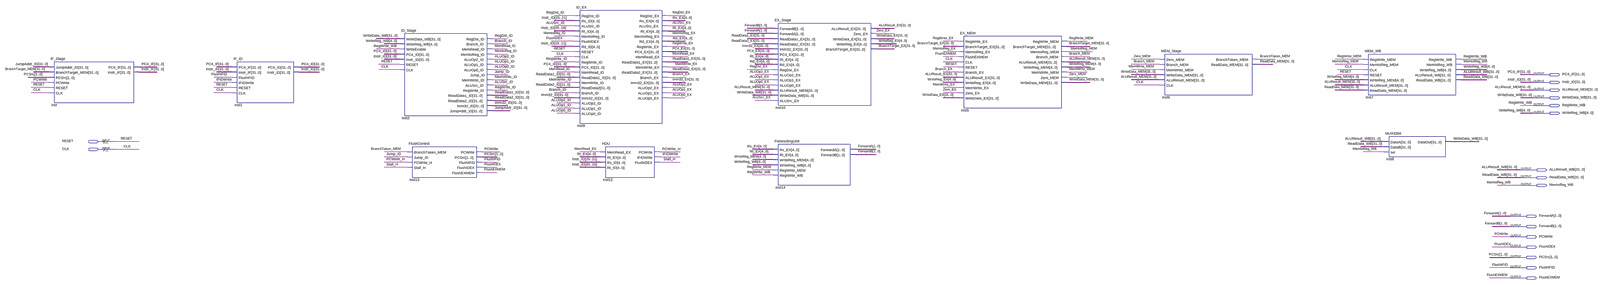
[diagram p0: schematic sheet, whole]
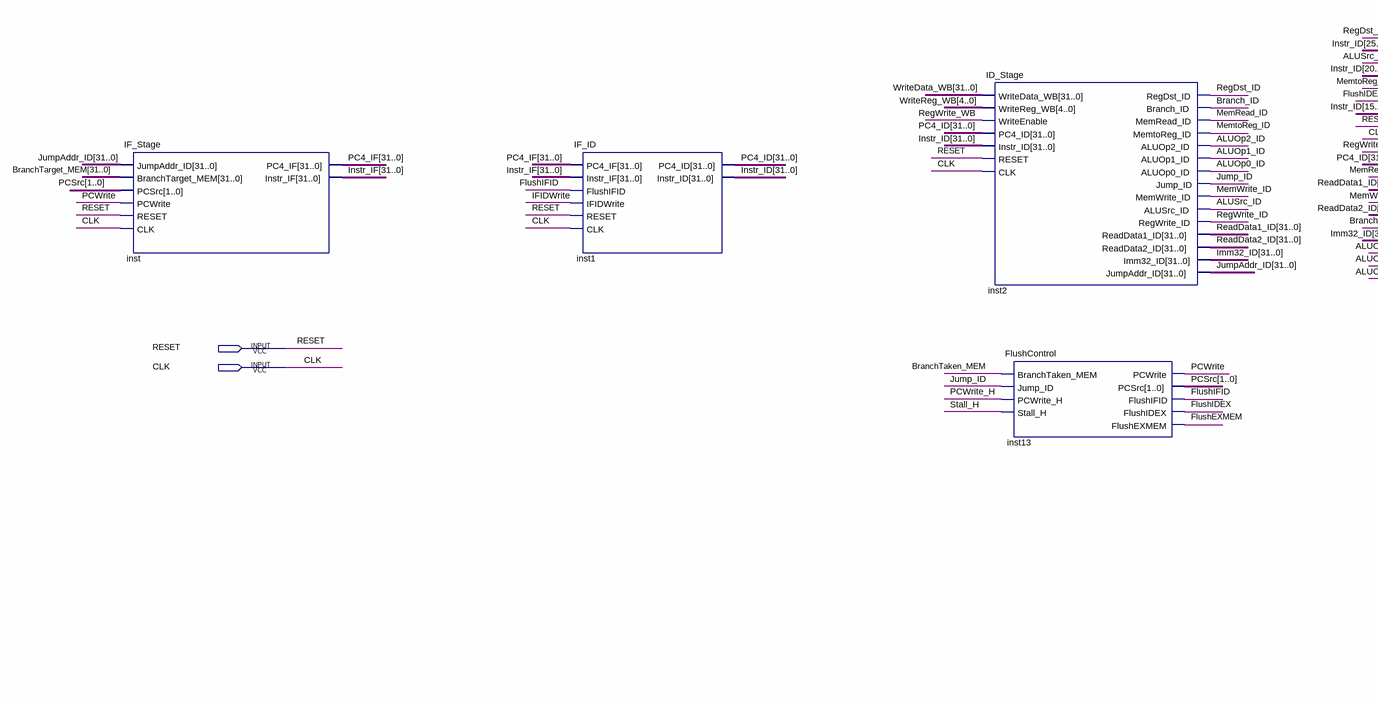
[diagram p1: schematic sheet, left part]
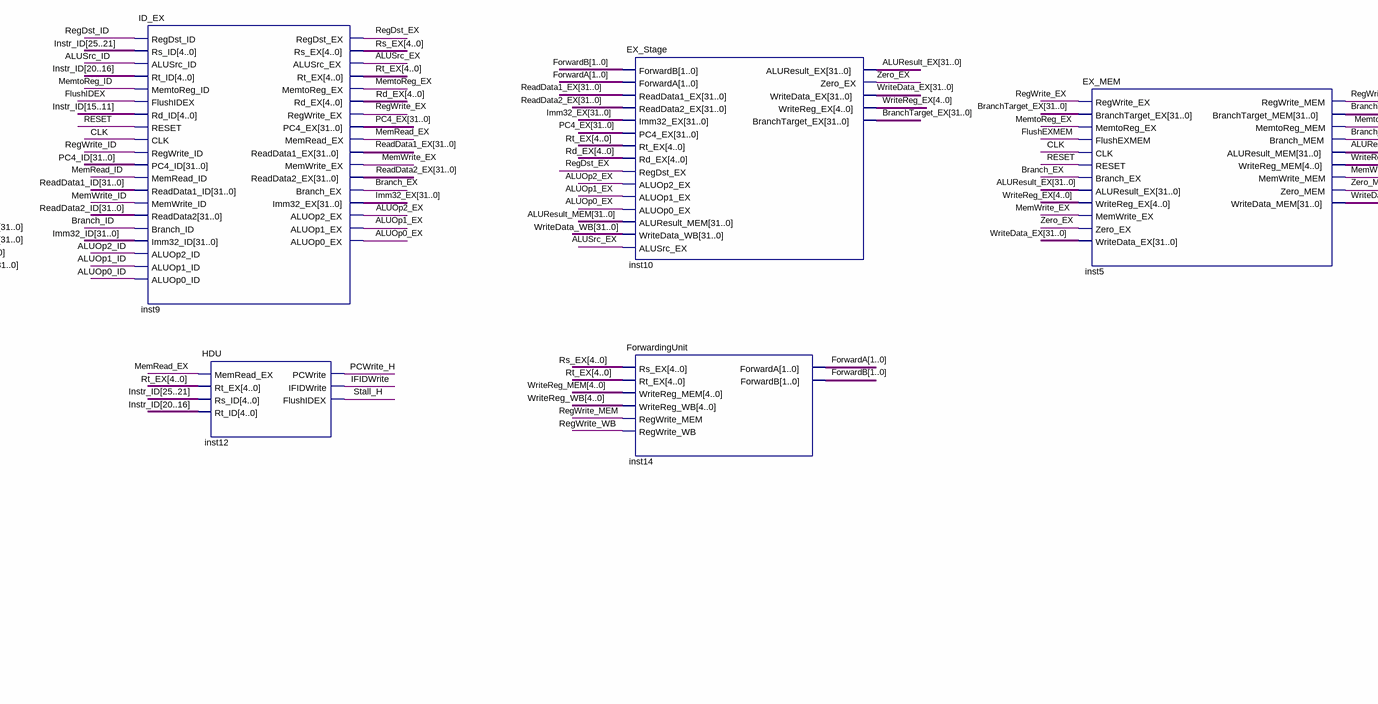
[diagram p2: schematic sheet, centre part]
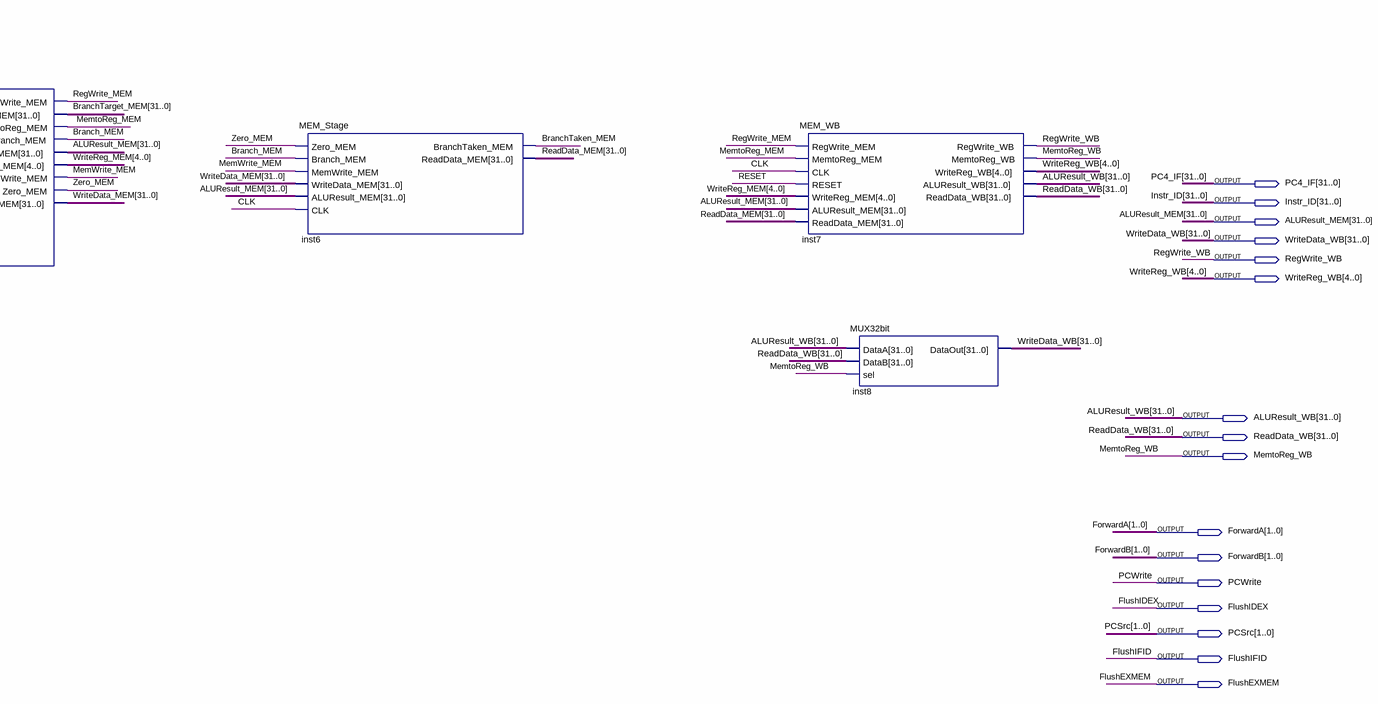
[diagram p3: schematic sheet, right part]
// Quartus schematic Top.bdf as structural Verilog: 12 symbols, 18 pins
module Top (
  input  RESET,
  input  CLK,
  output [31:0] PC4_IF,
  output [31:0] Instr_ID,
  output [31:0] ALUResult_MEM,
  output [31:0] WriteData_WB,
  output RegWrite_WB,
  output [4:0] WriteReg_WB,
  output [31:0] ALUResult_WB,
  output [31:0] ReadData_WB,
  output MemtoReg_WB,
  output [1:0] ForwardA,
  output [1:0] ForwardB,
  output PCWrite,
  output FlushIDEX,
  output [1:0] PCSrc,
  output FlushIFID,
  output FlushEXMEM
);

  wire ALUOp0_EX, ALUOp0_ID, ALUOp1_EX, ALUOp1_ID, ALUOp2_EX, ALUOp2_ID, ALUSrc_EX, ALUSrc_ID, Branch_EX,
       Branch_ID, Branch_MEM, BranchTaken_MEM, IFIDWrite, Jump_ID, MemRead_EX, MemRead_ID, MemtoReg_EX,
       MemtoReg_ID, MemtoReg_MEM, MemWrite_EX, MemWrite_ID, MemWrite_MEM, PCWrite_H, RegDst_EX, RegDst_ID,
       RegWrite_EX, RegWrite_ID, RegWrite_MEM, Stall_H, Zero_EX, Zero_MEM;
  wire [4:0] Rd_EX, Rs_EX, Rt_EX, WriteReg_EX, WriteReg_MEM;
  wire [31:0] ALUResult_EX, BranchTarget_EX, BranchTarget_MEM, Imm32_EX, Imm32_ID, Instr_IF, JumpAddr_ID,
       PC4_EX, PC4_ID, ReadData1_EX, ReadData1_ID, ReadData2_EX, ReadData2_ID, ReadData_MEM, WriteData_EX,
       WriteData_MEM;

  IF_Stage inst (
    .JumpAddr_ID(JumpAddr_ID), .BranchTarget_MEM(BranchTarget_MEM), .PCSrc(PCSrc), .PCWrite(PCWrite),
    .RESET(RESET), .CLK(CLK), .PC4_IF(PC4_IF), .Instr_IF(Instr_IF));
  IF_ID inst1 (
    .PC4_IF(PC4_IF), .Instr_IF(Instr_IF), .FlushIFID(FlushIFID), .IFIDWrite(IFIDWrite), .RESET(RESET),
    .CLK(CLK), .PC4_ID(PC4_ID), .Instr_ID(Instr_ID));
  ID_Stage inst2 (
    .WriteData_WB(WriteData_WB), .WriteReg_WB(WriteReg_WB), .WriteEnable(RegWrite_WB), .PC4_ID(PC4_ID),
    .Instr_ID(Instr_ID), .RESET(RESET), .CLK(CLK), .RegDst_ID(RegDst_ID), .Branch_ID(Branch_ID),
    .MemRead_ID(MemRead_ID), .MemtoReg_ID(MemtoReg_ID), .ALUOp2_ID(ALUOp2_ID), .ALUOp1_ID(ALUOp1_ID),
    .ALUOp0_ID(ALUOp0_ID), .Jump_ID(Jump_ID), .MemWrite_ID(MemWrite_ID), .ALUSrc_ID(ALUSrc_ID),
    .RegWrite_ID(RegWrite_ID), .ReadData1_ID(ReadData1_ID), .ReadData2_ID(ReadData2_ID), .Imm32_ID(Imm32_ID),
    .JumpAddr_ID(JumpAddr_ID));
  FlushControl inst13 (
    .BranchTaken_MEM(BranchTaken_MEM), .Jump_ID(Jump_ID), .PCWrite_H(PCWrite_H), .Stall_H(Stall_H),
    .PCWrite(PCWrite), .PCSrc(PCSrc), .FlushIFID(FlushIFID), .FlushIDEX(FlushIDEX), .FlushEXMEM(FlushEXMEM));
  ID_EX inst9 (
    .RegDst_ID(RegDst_ID), .Rs_ID(Instr_ID[25:21]), .ALUSrc_ID(ALUSrc_ID), .Rt_ID(Instr_ID[20:16]),
    .MemtoReg_ID(MemtoReg_ID), .FlushIDEX(FlushIDEX), .Rd_ID(Instr_ID[15:11]), .RESET(RESET), .CLK(CLK),
    .RegWrite_ID(RegWrite_ID), .PC4_ID(PC4_ID), .MemRead_ID(MemRead_ID), .ReadData1_ID(ReadData1_ID),
    .MemWrite_ID(MemWrite_ID), .ReadData2(ReadData2_ID), .Branch_ID(Branch_ID), .Imm32_ID(Imm32_ID),
    .ALUOp2_ID(ALUOp2_ID), .ALUOp1_ID(ALUOp1_ID), .ALUOp0_ID(ALUOp0_ID), .RegDst_EX(RegDst_EX),
    .Rs_EX(Rs_EX), .ALUSrc_EX(ALUSrc_EX), .Rt_EX(Rt_EX), .MemtoReg_EX(MemtoReg_EX), .Rd_EX(Rd_EX),
    .RegWrite_EX(RegWrite_EX), .PC4_EX(PC4_EX), .MemRead_EX(MemRead_EX), .ReadData1_EX(ReadData1_EX),
    .MemWrite_EX(MemWrite_EX), .ReadData2_EX(ReadData2_EX), .Branch_EX(Branch_EX), .Imm32_EX(Imm32_EX),
    .ALUOp2_EX(ALUOp2_EX), .ALUOp1_EX(ALUOp1_EX), .ALUOp0_EX(ALUOp0_EX));
  HDU inst12 (
    .MemRead_EX(MemRead_EX), .Rt_EX(Rt_EX), .Rs_ID(Instr_ID[25:21]), .Rt_ID(Instr_ID[20:16]),
    .PCWrite(PCWrite_H), .IFIDWrite(IFIDWrite), .FlushIDEX(Stall_H));
  EX_Stage inst10 (
    .ForwardB(ForwardB), .ForwardA(ForwardA), .ReadData1_EX(ReadData1_EX), .ReadData2_EX(ReadData2_EX),
    .Imm32_EX(Imm32_EX), .PC4_EX(PC4_EX), .Rt_EX(Rt_EX), .Rd_EX(Rd_EX), .RegDst_EX(RegDst_EX),
    .ALUOp2_EX(ALUOp2_EX), .ALUOp1_EX(ALUOp1_EX), .ALUOp0_EX(ALUOp0_EX), .ALUResult_MEM(ALUResult_MEM),
    .WriteData_WB(WriteData_WB), .ALUSrc_EX(ALUSrc_EX), .ALUResult_EX(ALUResult_EX), .Zero_EX(Zero_EX),
    .WriteData_EX(WriteData_EX), .WriteReg_EX(WriteReg_EX), .BranchTarget_EX(BranchTarget_EX));
  ForwardingUnit inst14 (
    .Rs_EX(Rs_EX), .Rt_EX(Rt_EX), .WriteReg_MEM(WriteReg_MEM), .WriteReg_WB(WriteReg_WB),
    .RegWrite_MEM(RegWrite_MEM), .RegWrite_WB(RegWrite_WB), .ForwardA(ForwardA), .ForwardB(ForwardB));
  EX_MEM inst5 (
    .RegWrite_EX(RegWrite_EX), .BranchTarget_EX(BranchTarget_EX), .MemtoReg_EX(MemtoReg_EX),
    .FlushEXMEM(FlushEXMEM), .CLK(CLK), .RESET(RESET), .Branch_EX(Branch_EX), .ALUResult_EX(ALUResult_EX),
    .WriteReg_EX(WriteReg_EX), .MemWrite_EX(MemWrite_EX), .Zero_EX(Zero_EX), .WriteData_EX(WriteData_EX),
    .RegWrite_MEM(RegWrite_MEM), .BranchTarget_MEM(BranchTarget_MEM), .MemtoReg_MEM(MemtoReg_MEM),
    .Branch_MEM(Branch_MEM), .ALUResult_MEM(ALUResult_MEM), .WriteReg_MEM(WriteReg_MEM),
    .MemWrite_MEM(MemWrite_MEM), .Zero_MEM(Zero_MEM), .WriteData_MEM(WriteData_MEM));
  MEM_Stage inst6 (
    .Zero_MEM(Zero_MEM), .Branch_MEM(Branch_MEM), .MemWrite_MEM(MemWrite_MEM), .WriteData_MEM(WriteData_MEM),
    .ALUResult_MEM(ALUResult_MEM), .CLK(CLK), .BranchTaken_MEM(BranchTaken_MEM), .ReadData_MEM(ReadData_MEM));
  MEM_WB inst7 (
    .RegWrite_MEM(RegWrite_MEM), .MemtoReg_MEM(MemtoReg_MEM), .CLK(CLK), .RESET(RESET),
    .WriteReg_MEM(WriteReg_MEM), .ALUResult_MEM(ALUResult_MEM), .ReadData_MEM(ReadData_MEM),
    .RegWrite_WB(RegWrite_WB), .MemtoReg_WB(MemtoReg_WB), .WriteReg_WB(WriteReg_WB),
    .ALUResult_WB(ALUResult_WB), .ReadData_WB(ReadData_WB));
  MUX32bit inst8 (.DataA(ALUResult_WB), .DataB(ReadData_WB), .sel(MemtoReg_WB), .DataOut(WriteData_WB));
endmodule
